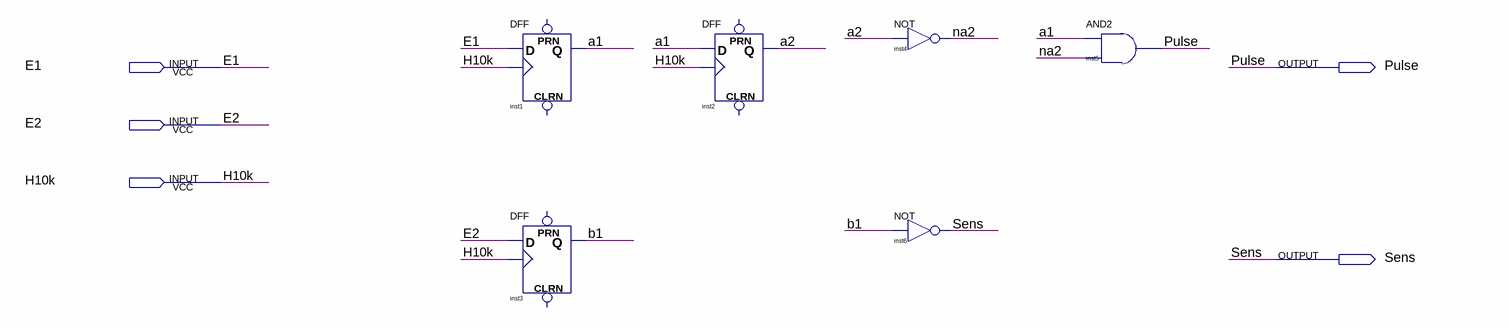
[diagram p0: schematic sheet]
// Quartus schematic InterfaceBouton.bdf as structural Verilog: 6 symbols, 5 pins
module InterfaceBouton (
  input  E1,
  input  E2,
  input  H10k,
  output Pulse,
  output Sens
);

  wire a1, a2, b1, na2;

  DFF inst1 (.CLK(H10k), .D(E1), .Q(a1));  // open: CLRN, PRN
  DFF inst3 (.CLK(H10k), .D(E2), .Q(b1));  // open: CLRN, PRN
  DFF inst2 (.CLK(H10k), .D(a1), .Q(a2));  // open: CLRN, PRN
  not inst4 (na2, a2);
  not inst6 (Sens, b1);
  and inst5 (Pulse, a1, na2);
endmodule
